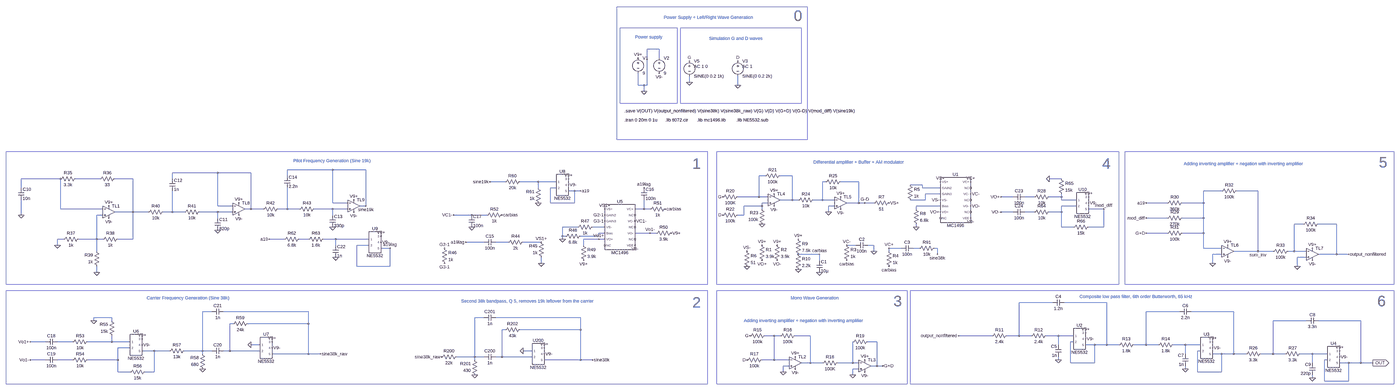
[diagram p0: schematic FM_Encoder.asc, whole sheet]
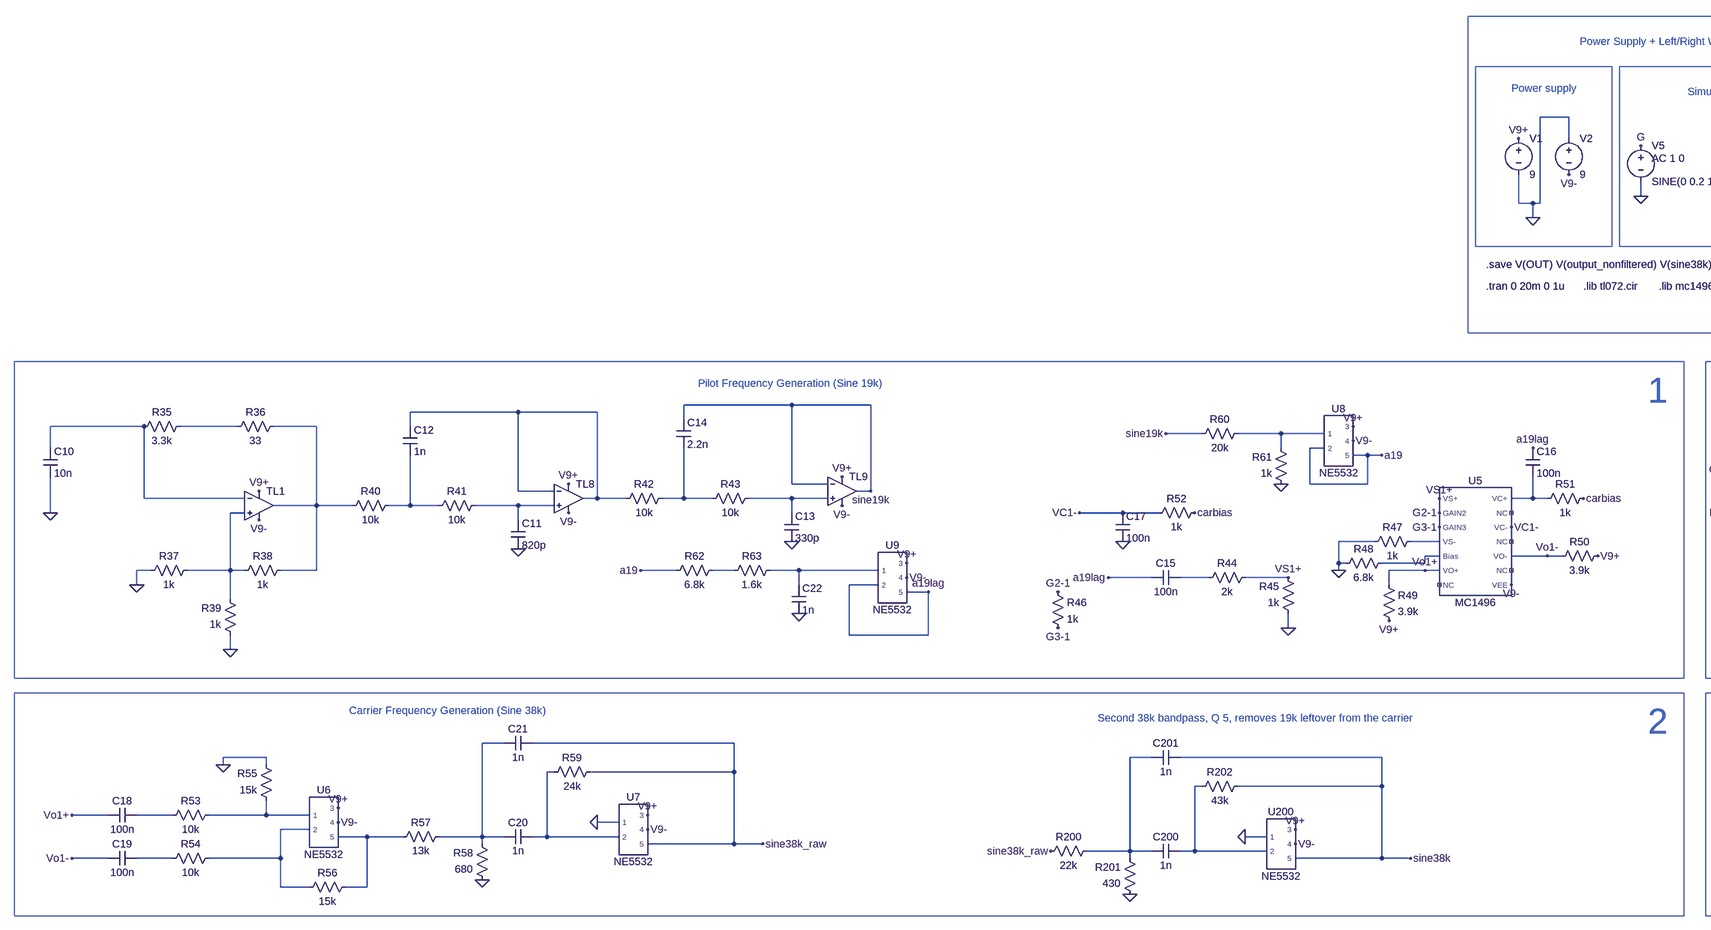
[diagram p1: schematic FM_Encoder.asc, part, row 1 of 1, column 1 of 2]
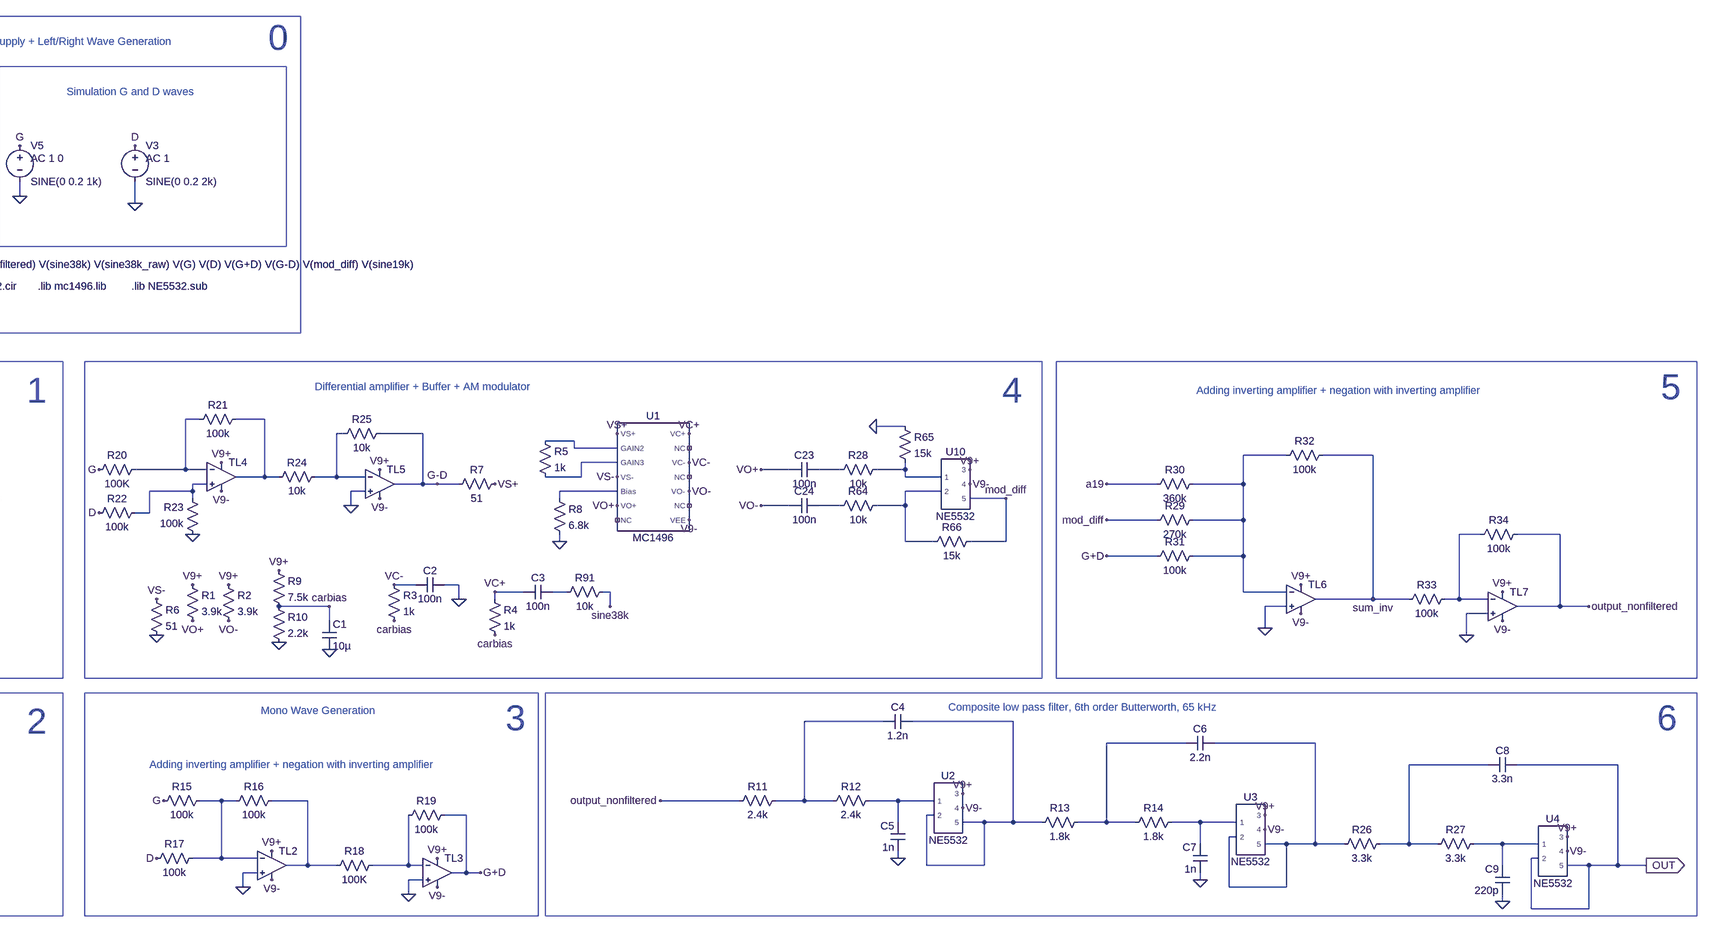
[diagram p2: schematic FM_Encoder.asc, part, row 1 of 1, column 2 of 2]
FM_Encoder.asc, the LTspice schematic file:
Version 4.1
SHEET 1 17428 680
WIRE -4272 -6784 -4336 -6784
WIRE -4272 -6736 -4272 -6784
WIRE -4112 -6608 -4112 -6640
WIRE -4384 -6592 -4384 -6656
WIRE -4352 -6592 -4384 -6592
WIRE -4336 -6592 -4336 -6784
WIRE -4336 -6592 -4352 -6592
WIRE -3856 -6592 -3856 -6640
WIRE -4352 -6560 -4352 -6592
WIRE -6000 -6144 -6240 -6144
WIRE -5824 -6144 -6000 -6144
WIRE -6608 -6128 -6848 -6128
WIRE -6432 -6128 -6608 -6128
WIRE -6240 -6112 -6240 -6144
WIRE -3712 -6112 -3744 -6112
WIRE -3568 -6112 -3632 -6112
WIRE -7440 -6096 -7648 -6096
WIRE -7232 -6096 -7360 -6096
WIRE -7056 -6096 -7152 -6096
WIRE -6848 -6096 -6848 -6128
WIRE -2144 -6096 -2208 -6096
WIRE -5088 -6080 -5168 -6080
WIRE -4912 -6080 -5008 -6080
WIRE -4816 -6080 -4912 -6080
WIRE -3392 -6080 -3408 -6080
WIRE -3216 -6080 -3312 -6080
WIRE -2880 -6064 -2944 -6064
WIRE -7648 -6048 -7648 -6096
WIRE -4912 -6048 -4912 -6080
WIRE -4816 -6048 -4848 -6048
WIRE -2880 -6048 -2880 -6064
WIRE -2784 -6048 -2880 -6048
WIRE -4720 -6032 -4752 -6032
WIRE -4688 -6032 -4720 -6032
WIRE -1296 -6032 -1392 -6032
WIRE -1104 -6032 -1216 -6032
WIRE -2784 -6016 -2864 -6016
WIRE -3744 -6000 -3744 -6112
WIRE -3744 -6000 -3856 -6000
WIRE -3696 -6000 -3744 -6000
WIRE -2400 -6000 -2464 -6000
WIRE -2288 -6000 -2336 -6000
WIRE -2144 -6000 -2144 -6016
WIRE -2144 -6000 -2208 -6000
WIRE -3568 -5984 -3568 -6112
WIRE -3568 -5984 -3632 -5984
WIRE -3536 -5984 -3568 -5984
WIRE -3408 -5984 -3408 -6080
WIRE -3408 -5984 -3456 -5984
WIRE -3344 -5984 -3408 -5984
WIRE -2864 -5984 -2864 -6016
WIRE -2864 -5984 -2944 -5984
WIRE -2144 -5984 -2144 -6000
WIRE -2064 -5984 -2144 -5984
WIRE -6000 -5968 -6000 -6144
WIRE -5920 -5968 -6000 -5968
WIRE -4848 -5968 -4848 -6048
WIRE -4720 -5968 -4720 -6032
WIRE -4720 -5968 -4848 -5968
WIRE -3696 -5968 -3728 -5968
WIRE -3216 -5968 -3216 -6080
WIRE -3216 -5968 -3280 -5968
WIRE -3184 -5968 -3216 -5968
WIRE -3136 -5968 -3184 -5968
WIRE -1584 -5968 -1696 -5968
WIRE -1392 -5968 -1392 -6032
WIRE -1392 -5968 -1504 -5968
WIRE -6608 -5952 -6608 -6128
WIRE -6528 -5952 -6608 -5952
WIRE -5824 -5952 -5824 -6144
WIRE -5824 -5952 -5856 -5952
WIRE -3728 -5952 -3728 -5968
WIRE -3728 -5952 -3824 -5952
WIRE -3344 -5952 -3376 -5952
WIRE -2784 -5952 -2912 -5952
WIRE -2064 -5952 -2144 -5952
WIRE -7440 -5936 -7440 -6096
WIRE -7216 -5936 -7440 -5936
WIRE -6432 -5936 -6432 -6128
WIRE -6432 -5936 -6464 -5936
WIRE -6368 -5936 -6432 -5936
WIRE -6240 -5936 -6240 -6048
WIRE -6240 -5936 -6288 -5936
WIRE -6176 -5936 -6240 -5936
WIRE -6000 -5936 -6096 -5936
WIRE -5920 -5936 -6000 -5936
WIRE -4352 -5936 -4352 -5984
WIRE -4352 -5936 -4400 -5936
WIRE -4320 -5936 -4352 -5936
WIRE -3728 -5936 -3728 -5952
WIRE -2912 -5936 -2912 -5952
WIRE -1920 -5936 -2000 -5936
WIRE -7056 -5920 -7056 -6096
WIRE -7056 -5920 -7152 -5920
WIRE -6976 -5920 -7056 -5920
WIRE -6848 -5920 -6848 -6032
WIRE -6848 -5920 -6896 -5920
WIRE -6784 -5920 -6848 -5920
WIRE -6608 -5920 -6704 -5920
WIRE -6528 -5920 -6608 -5920
WIRE -3376 -5920 -3376 -5952
WIRE -2400 -5920 -2464 -5920
WIRE -2288 -5920 -2336 -5920
WIRE -2144 -5920 -2144 -5952
WIRE -2144 -5920 -2208 -5920
WIRE -7648 -5904 -7648 -5984
WIRE -7216 -5904 -7248 -5904
WIRE -6000 -5904 -6000 -5936
WIRE -5264 -5904 -5360 -5904
WIRE -5184 -5904 -5264 -5904
WIRE -3824 -5904 -3824 -5952
WIRE -3824 -5904 -3856 -5904
WIRE -6608 -5888 -6608 -5920
WIRE -1584 -5888 -1696 -5888
WIRE -1392 -5888 -1392 -5968
WIRE -1392 -5888 -1504 -5888
WIRE -864 -5856 -912 -5856
WIRE -688 -5856 -784 -5856
WIRE -4704 -5840 -4784 -5840
WIRE -4560 -5840 -4624 -5840
WIRE -2912 -5840 -2912 -5856
WIRE -2144 -5840 -2144 -5920
WIRE -2080 -5840 -2144 -5840
WIRE -1920 -5840 -1920 -5936
WIRE -1920 -5840 -2000 -5840
WIRE -4560 -5808 -4592 -5808
WIRE -4320 -5808 -4400 -5808
WIRE -4288 -5808 -4320 -5808
WIRE -1584 -5808 -1696 -5808
WIRE -1392 -5808 -1392 -5888
WIRE -1392 -5808 -1504 -5808
WIRE -4784 -5792 -4784 -5840
WIRE -4768 -5792 -4784 -5792
WIRE -4592 -5792 -4592 -5808
WIRE -4592 -5792 -4688 -5792
WIRE -7424 -5776 -7456 -5776
WIRE -7248 -5776 -7248 -5904
WIRE -7248 -5776 -7344 -5776
WIRE -7216 -5776 -7248 -5776
WIRE -7056 -5776 -7056 -5920
WIRE -7056 -5776 -7136 -5776
WIRE -6256 -5776 -6336 -5776
WIRE -6128 -5776 -6176 -5776
WIRE -5984 -5776 -6048 -5776
WIRE -5808 -5776 -5984 -5776
WIRE -4784 -5776 -4784 -5792
WIRE -4592 -5776 -4672 -5776
WIRE -4560 -5776 -4592 -5776
WIRE -5200 -5760 -5296 -5760
WIRE -5072 -5760 -5136 -5760
WIRE -4896 -5760 -4992 -5760
WIRE -7456 -5744 -7456 -5776
WIRE -5984 -5744 -5984 -5776
WIRE -5808 -5744 -5872 -5744
WIRE -4672 -5744 -4672 -5776
WIRE -3232 -5744 -3280 -5744
WIRE -3136 -5744 -3168 -5744
WIRE -5696 -5728 -5744 -5728
WIRE -2992 -5728 -3056 -5728
WIRE -2896 -5728 -2928 -5728
WIRE -2800 -5728 -2816 -5728
WIRE -1392 -5728 -1392 -5808
WIRE -1296 -5728 -1392 -5728
WIRE -7248 -5712 -7248 -5776
WIRE -3136 -5712 -3136 -5744
WIRE -3056 -5712 -3056 -5728
WIRE -1104 -5712 -1104 -6032
WIRE -1104 -5712 -1232 -5712
WIRE -1024 -5712 -1104 -5712
WIRE -912 -5712 -912 -5856
WIRE -912 -5712 -944 -5712
WIRE -848 -5712 -912 -5712
WIRE -3424 -5696 -3536 -5696
WIRE -2800 -5696 -2800 -5728
WIRE -1296 -5696 -1344 -5696
WIRE -688 -5696 -688 -5856
WIRE -688 -5696 -784 -5696
WIRE -624 -5696 -688 -5696
WIRE -848 -5680 -896 -5680
WIRE -3424 -5664 -3424 -5696
WIRE -4896 -5648 -4896 -5680
WIRE -1344 -5648 -1344 -5696
WIRE -5872 -5632 -5872 -5744
WIRE -5696 -5632 -5696 -5728
WIRE -5696 -5632 -5872 -5632
WIRE -896 -5632 -896 -5680
WIRE -7248 -5600 -7248 -5632
WIRE -2192 -5440 -2368 -5440
WIRE -1904 -5440 -2128 -5440
WIRE -6640 -5392 -6688 -5392
WIRE -6128 -5392 -6576 -5392
WIRE -1520 -5392 -1696 -5392
WIRE -1232 -5392 -1456 -5392
WIRE -7168 -5360 -7264 -5360
WIRE -5200 -5360 -5248 -5360
WIRE -4688 -5360 -5136 -5360
WIRE -7264 -5344 -7264 -5360
WIRE -7168 -5344 -7168 -5360
WIRE -848 -5344 -1024 -5344
WIRE -560 -5344 -784 -5344
WIRE -6528 -5328 -6544 -5328
WIRE -6128 -5328 -6128 -5392
WIRE -6128 -5328 -6448 -5328
WIRE -5088 -5296 -5104 -5296
WIRE -4688 -5296 -4688 -5360
WIRE -4688 -5296 -5008 -5296
WIRE -3664 -5264 -3712 -5264
WIRE -3632 -5264 -3664 -5264
WIRE -3472 -5264 -3552 -5264
WIRE -2512 -5264 -2688 -5264
WIRE -2368 -5264 -2368 -5440
WIRE -2368 -5264 -2432 -5264
WIRE -2304 -5264 -2368 -5264
WIRE -2160 -5264 -2224 -5264
WIRE -2080 -5264 -2160 -5264
WIRE -7520 -5232 -7600 -5232
WIRE -7376 -5232 -7456 -5232
WIRE -7168 -5232 -7168 -5264
WIRE -7168 -5232 -7296 -5232
WIRE -7072 -5232 -7168 -5232
WIRE -3120 -5232 -3168 -5232
WIRE -2080 -5232 -2096 -5232
WIRE -6384 -5216 -6432 -5216
WIRE -2160 -5216 -2160 -5264
WIRE -1968 -5216 -2016 -5216
WIRE -1904 -5216 -1904 -5440
WIRE -1904 -5216 -1968 -5216
WIRE -1840 -5216 -1904 -5216
WIRE -1696 -5216 -1696 -5392
WIRE -1696 -5216 -1760 -5216
WIRE -1632 -5216 -1696 -5216
WIRE -1488 -5216 -1552 -5216
WIRE -1408 -5216 -1488 -5216
WIRE -7072 -5200 -7136 -5200
WIRE -6944 -5184 -7008 -5184
WIRE -6864 -5184 -6944 -5184
WIRE -6688 -5184 -6688 -5392
WIRE -6688 -5184 -6784 -5184
WIRE -6640 -5184 -6688 -5184
WIRE -6544 -5184 -6544 -5328
WIRE -6544 -5184 -6576 -5184
WIRE -6384 -5184 -6544 -5184
WIRE -4944 -5184 -4992 -5184
WIRE -1408 -5184 -1424 -5184
WIRE -6688 -5168 -6688 -5184
WIRE -6128 -5168 -6128 -5328
WIRE -6128 -5168 -6320 -5168
WIRE -6064 -5168 -6128 -5168
WIRE -1488 -5168 -1488 -5216
WIRE -1296 -5168 -1344 -5168
WIRE -1232 -5168 -1232 -5392
WIRE -1232 -5168 -1296 -5168
WIRE -1168 -5168 -1232 -5168
WIRE -1024 -5168 -1024 -5344
WIRE -1024 -5168 -1088 -5168
WIRE -960 -5168 -1024 -5168
WIRE -816 -5168 -880 -5168
WIRE -736 -5168 -816 -5168
WIRE -5248 -5152 -5248 -5360
WIRE -5248 -5152 -5344 -5152
WIRE -5200 -5152 -5248 -5152
WIRE -5104 -5152 -5104 -5296
WIRE -5104 -5152 -5136 -5152
WIRE -4944 -5152 -5104 -5152
WIRE -7520 -5136 -7600 -5136
WIRE -7376 -5136 -7456 -5136
WIRE -7136 -5136 -7136 -5200
WIRE -7136 -5136 -7296 -5136
WIRE -5248 -5136 -5248 -5152
WIRE -4688 -5136 -4688 -5296
WIRE -4688 -5136 -4880 -5136
WIRE -4624 -5136 -4688 -5136
WIRE -3664 -5136 -3664 -5264
WIRE -3664 -5136 -3728 -5136
WIRE -3584 -5136 -3664 -5136
WIRE -2160 -5136 -2160 -5152
WIRE -736 -5136 -752 -5136
WIRE -3472 -5120 -3472 -5264
WIRE -3472 -5120 -3520 -5120
WIRE -3408 -5120 -3472 -5120
WIRE -3248 -5120 -3248 -5232
WIRE -3248 -5120 -3328 -5120
WIRE -3216 -5120 -3248 -5120
WIRE -2096 -5120 -2096 -5232
WIRE -1968 -5120 -1968 -5216
WIRE -1968 -5120 -2096 -5120
WIRE -816 -5120 -816 -5168
WIRE -624 -5120 -672 -5120
WIRE -560 -5120 -560 -5344
WIRE -560 -5120 -624 -5120
WIRE -496 -5120 -560 -5120
WIRE -3584 -5104 -3616 -5104
WIRE -3120 -5104 -3120 -5232
WIRE -3120 -5104 -3152 -5104
WIRE -3088 -5104 -3120 -5104
WIRE -3216 -5088 -3248 -5088
WIRE -1488 -5088 -1488 -5104
WIRE -7136 -5072 -7136 -5136
WIRE -7072 -5072 -7136 -5072
WIRE -6944 -5072 -6944 -5184
WIRE -6944 -5072 -6992 -5072
WIRE -3616 -5072 -3616 -5104
WIRE -1424 -5072 -1424 -5184
WIRE -1296 -5072 -1296 -5168
WIRE -1296 -5072 -1424 -5072
WIRE -3248 -5056 -3248 -5088
WIRE -816 -5040 -816 -5056
WIRE -752 -5024 -752 -5136
WIRE -624 -5024 -624 -5120
WIRE -624 -5024 -752 -5024
FLAG -4384 -6736 V9+
FLAG -4272 -6656 V9-
FLAG -4352 -6560 0
FLAG -3808 -5136 D
FLAG -3792 -5264 G
FLAG -3552 -5152 V9+
FLAG -3552 -5088 V9-
FLAG -3616 -5072 0
FLAG -3184 -5136 V9+
FLAG -3184 -5072 V9-
FLAG -3248 -5056 0
FLAG -3088 -5104 G+D
FLAG -3664 -6016 V9+
FLAG -3664 -5952 V9-
FLAG -3728 -5856 0
FLAG -3936 -5904 D
FLAG -3936 -6000 G
FLAG -3312 -6000 V9+
FLAG -3312 -5936 V9-
FLAG -3376 -5920 0
FLAG -1696 -5968 a19
FLAG -1696 -5888 mod_diff
FLAG -1696 -5808 G+D
FLAG -1264 -5744 V9+
FLAG -1264 -5680 V9-
FLAG -1344 -5648 0
FLAG -816 -5728 V9+
FLAG -816 -5664 V9-
FLAG -896 -5632 0
FLAG -624 -5696 output_nonfiltered
FLAG -4112 -6608 0
FLAG -3856 -6592 0
FLAG -4112 -6720 G
FLAG -3856 -6720 D
FLAG -3184 -5968 G-D
FLAG -2624 -5888 V9-
FLAG -2784 -5920 VO+
FLAG -2624 -5952 VO-
FLAG -3648 -5664 VO-
FLAG -3728 -5664 VO+
FLAG -3728 -5744 V9+
FLAG -3648 -5744 V9+
FLAG -3808 -5632 0
FLAG -3808 -5712 VS-
FLAG -2784 -5984 VS-
FLAG -2624 -6016 VC-
FLAG -3280 -5744 VC-
FLAG -2784 -6080 VS+
FLAG -3056 -5968 VS+
FLAG -2912 -5840 0
FLAG -3280 -5664 carbias
FLAG -3536 -5616 0
FLAG -3424 -5600 0
FLAG -3536 -5776 V9+
FLAG -2624 -6080 VC+
FLAG -3136 -5712 0
FLAG -3056 -5728 VC+
FLAG -3056 -5632 carbias
FLAG -2800 -5696 sine38k
FLAG -3424 -5696 carbias
FLAG -2688 -5264 output_nonfiltered
FLAG -2160 -5136 0
FLAG -2016 -5280 V9+
FLAG -2016 -5248 V9-
FLAG -1488 -5088 0
FLAG -1344 -5232 V9+
FLAG -1344 -5200 V9-
FLAG -816 -5040 0
FLAG -672 -5184 V9+
FLAG -672 -5152 V9-
FLAG -496 -5120 OUT
IOPIN -496 -5120 Out
FLAG -7184 -5952 V9+
FLAG -7184 -5888 V9-
FLAG -7648 -5904 0
FLAG -7456 -5744 0
FLAG -7248 -5600 0
FLAG -6496 -5968 V9+
FLAG -6496 -5904 V9-
FLAG -6608 -5824 0
FLAG -5888 -5984 V9+
FLAG -5888 -5920 V9-
FLAG -6000 -5840 0
FLAG -5824 -5952 sine19k
FLAG -5296 -5760 a19lag
FLAG -4896 -5648 0
FLAG -4896 -5760 VS1+
FLAG -4560 -5936 VS1+
FLAG -4560 -5904 G2-1
FLAG -5408 -5728 G2-1
FLAG -4560 -5872 G3-1
FLAG -5408 -5648 G3-1
FLAG -4784 -5776 0
FLAG -4672 -5664 V9+
FLAG -4592 -5776 Vo1+
FLAG -4400 -5744 V9-
FLAG -4208 -5808 V9+
FLAG -4320 -5808 Vo1-
FLAG -4352 -6048 a19lag
FLAG -4400 -5872 VC1-
FLAG -5360 -5904 VC1-
FLAG -5264 -5840 0
FLAG -5104 -5904 carbias
FLAG -4240 -5936 carbias
FLAG -7600 -5232 Vo1+
FLAG -7600 -5136 Vo1-
FLAG -7264 -5344 0
FLAG -7008 -5248 V9+
FLAG -7008 -5216 V9-
FLAG -6688 -5088 0
FLAG -6432 -5216 0
FLAG -6320 -5232 V9+
FLAG -6320 -5200 V9-
FLAG -5168 -6080 sine19k
FLAG -4912 -5968 0
FLAG -4688 -6032 a19
FLAG -4752 -6096 V9+
FLAG -4752 -6064 V9-
FLAG -6064 -5168 sine38k_raw
FLAG -6336 -5776 a19
FLAG -5984 -5680 0
FLAG -5696 -5728 a19lag
FLAG -5744 -5792 V9+
FLAG -5744 -5760 V9-
FLAG -1104 -5712 sum_inv
FLAG -2464 -5920 VO-
FLAG -2464 -6000 VO+
FLAG -2000 -6000 V9+
FLAG -2000 -5968 V9-
FLAG -1920 -5936 mod_diff
FLAG -2208 -6096 0
FLAG -5248 -5056 0
FLAG -4992 -5184 0
FLAG -4880 -5200 V9+
FLAG -4880 -5168 V9-
FLAG -4624 -5136 sine38k
FLAG -5424 -5152 sine38k_raw
SYMBOL voltage -4384 -6752 R0
WINDOW 123 0 0 Left 0
WINDOW 39 0 0 Left 0
SYMATTR InstName V1
SYMATTR Value 9
SYMBOL voltage -4272 -6752 R0
WINDOW 123 0 0 Left 0
WINDOW 39 0 0 Left 0
SYMATTR InstName V2
SYMATTR Value 9
SYMBOL res -3696 -5280 R90
WINDOW 0 0 56 VBottom 2
WINDOW 3 32 56 VTop 2
SYMATTR InstName R15
SYMATTR Value 100k
SYMBOL res -3536 -5280 R90
WINDOW 0 0 56 VBottom 2
WINDOW 3 32 56 VTop 2
SYMATTR InstName R16
SYMATTR Value 100k
SYMBOL res -3712 -5152 R90
WINDOW 0 0 56 VBottom 2
WINDOW 3 32 56 VTop 2
SYMATTR InstName R17
SYMATTR Value 100k
SYMBOL OpAmps\\opamp2 -3552 -5184 R0
SYMATTR InstName TL2
SYMATTR Value ""
SYMATTR SpiceModel TL072
SYMBOL res -3312 -5136 R90
WINDOW 0 0 56 VBottom 2
WINDOW 3 32 56 VTop 2
SYMATTR InstName R18
SYMATTR Value 100K
SYMBOL res -3152 -5248 R90
WINDOW 0 0 56 VBottom 2
WINDOW 3 32 56 VTop 2
SYMATTR InstName R19
SYMATTR Value 100k
SYMBOL OpAmps\\opamp2 -3184 -5168 R0
SYMATTR InstName TL3
SYMATTR Value ""
SYMATTR SpiceModel TL072
SYMBOL res -3840 -6016 R90
WINDOW 0 0 56 VBottom 2
WINDOW 3 32 56 VTop 2
SYMATTR InstName R20
SYMATTR Value 100K
SYMBOL res -3616 -6128 R90
WINDOW 0 0 56 VBottom 2
WINDOW 3 32 56 VTop 2
SYMATTR InstName R21
SYMATTR Value 100k
SYMBOL res -3840 -5920 R90
WINDOW 0 0 56 VBottom 2
WINDOW 3 32 56 VTop 2
SYMATTR InstName R22
SYMATTR Value 100k
SYMBOL res -3712 -5840 R180
WINDOW 0 36 76 Left 2
WINDOW 3 36 40 Left 2
SYMATTR InstName R23
SYMATTR Value 100k
SYMBOL OpAmps\\opamp2 -3664 -6048 R0
SYMATTR InstName TL4
SYMATTR Value ""
SYMATTR SpiceModel TL072
SYMBOL res -3440 -6000 R90
WINDOW 0 0 56 VBottom 2
WINDOW 3 32 56 VTop 2
SYMATTR InstName R24
SYMATTR Value 10k
SYMBOL res -3296 -6096 R90
WINDOW 0 0 56 VBottom 2
WINDOW 3 32 56 VTop 2
SYMATTR InstName R25
SYMATTR Value 10k
SYMBOL OpAmps\\opamp2 -3312 -6032 R0
SYMATTR InstName TL5
SYMATTR Value ""
SYMATTR SpiceModel TL072
SYMBOL res -1488 -5904 R90
WINDOW 0 0 56 VBottom 2
WINDOW 3 32 56 VTop 2
SYMATTR InstName R29
SYMATTR Value 270k
SYMBOL res -1488 -5984 R90
WINDOW 0 0 56 VBottom 2
WINDOW 3 32 56 VTop 2
SYMATTR InstName R30
SYMATTR Value 360k
SYMBOL res -1488 -5824 R90
WINDOW 0 0 56 VBottom 2
WINDOW 3 32 56 VTop 2
SYMATTR InstName R31
SYMATTR Value 100k
SYMBOL res -1200 -6048 R90
WINDOW 0 0 56 VBottom 2
WINDOW 3 32 56 VTop 2
SYMATTR InstName R32
SYMATTR Value 100k
SYMBOL OpAmps\\opamp2 -1264 -5776 R0
SYMATTR InstName TL6
SYMATTR Value ""
SYMATTR SpiceModel TL072
SYMBOL res -928 -5728 R90
WINDOW 0 0 56 VBottom 2
WINDOW 3 32 56 VTop 2
SYMATTR InstName R33
SYMATTR Value 100k
SYMBOL OpAmps\\opamp2 -816 -5760 R0
SYMATTR InstName TL7
SYMATTR Value ""
SYMATTR SpiceModel TL072
SYMBOL res -768 -5872 R90
WINDOW 0 0 56 VBottom 2
WINDOW 3 32 56 VTop 2
SYMATTR InstName R34
SYMATTR Value 100k
SYMBOL voltage -4112 -6736 R0
WINDOW 123 24 44 Left 2
WINDOW 39 0 0 Left 0
SYMATTR Value2 AC 1 0
SYMATTR InstName V5
SYMATTR Value SINE(0 0.2 1k)
SYMBOL MC1496 -2704 -5984 R0
SYMATTR InstName U1
SYMBOL res -3744 -5760 R0
SYMATTR InstName R1
SYMATTR Value 3.9k
SYMBOL res -3664 -5760 R0
SYMATTR InstName R2
SYMATTR Value 3.9k
SYMBOL res -2960 -6080 R0
SYMATTR InstName R5
SYMATTR Value 1k
SYMBOL res -3824 -5728 R0
SYMATTR InstName R6
SYMATTR Value 51
SYMBOL res -3296 -5760 R0
SYMATTR InstName R3
SYMATTR Value 1k
SYMBOL res -3040 -5984 R90
WINDOW 0 0 56 VBottom 2
WINDOW 3 32 56 VTop 2
SYMATTR InstName R7
SYMATTR Value 51
SYMBOL res -2928 -5952 R0
SYMATTR InstName R8
SYMATTR Value 6.8k
SYMBOL res -3552 -5792 R0
SYMATTR InstName R9
SYMATTR Value 7.5k
SYMBOL res -3552 -5712 R0
SYMATTR InstName R10
SYMATTR Value 2.2k
SYMBOL cap -3440 -5664 R0
SYMATTR InstName C1
SYMATTR Value 10µ
SYMBOL cap -3168 -5760 R90
WINDOW 0 0 32 VBottom 2
WINDOW 3 32 32 VTop 2
SYMATTR InstName C2
SYMATTR Value 100n
SYMBOL res -3072 -5728 R0
SYMATTR InstName R4
SYMATTR Value 1k
SYMBOL cap -2928 -5744 R90
WINDOW 0 0 32 VBottom 2
WINDOW 3 32 32 VTop 2
SYMATTR InstName C3
SYMATTR Value 100n
SYMBOL res -2416 -5280 R90
WINDOW 0 0 56 VBottom 2
WINDOW 3 32 56 VTop 2
SYMATTR InstName R11
SYMATTR Value 2.4k
SYMBOL res -2208 -5280 R90
WINDOW 0 0 56 VBottom 2
WINDOW 3 32 56 VTop 2
SYMATTR InstName R12
SYMATTR Value 2.4k
SYMBOL cap -2128 -5456 R90
WINDOW 0 0 32 VBottom 2
WINDOW 3 32 32 VTop 2
SYMATTR InstName C4
SYMATTR Value 1.2n
SYMBOL cap -2144 -5152 R180
WINDOW 0 24 56 Left 2
WINDOW 3 24 8 Left 2
SYMATTR InstName C5
SYMATTR Value 1n
SYMBOL NE5532 -2048 -5248 R0
SYMATTR InstName U2
SYMBOL res -1744 -5232 R90
WINDOW 0 0 56 VBottom 2
WINDOW 3 32 56 VTop 2
SYMATTR InstName R13
SYMATTR Value 1.8k
SYMBOL res -1536 -5232 R90
WINDOW 0 0 56 VBottom 2
WINDOW 3 32 56 VTop 2
SYMATTR InstName R14
SYMATTR Value 1.8k
SYMBOL cap -1456 -5408 R90
WINDOW 0 0 32 VBottom 2
WINDOW 3 32 32 VTop 2
SYMATTR InstName C6
SYMATTR Value 2.2n
SYMBOL cap -1472 -5104 R180
WINDOW 0 24 56 Left 2
WINDOW 3 24 8 Left 2
SYMATTR InstName C7
SYMATTR Value 1n
SYMBOL NE5532 -1376 -5200 R0
SYMATTR InstName U3
SYMBOL res -1072 -5184 R90
WINDOW 0 0 56 VBottom 2
WINDOW 3 32 56 VTop 2
SYMATTR InstName R26
SYMATTR Value 3.3k
SYMBOL res -864 -5184 R90
WINDOW 0 0 56 VBottom 2
WINDOW 3 32 56 VTop 2
SYMATTR InstName R27
SYMATTR Value 3.3k
SYMBOL cap -784 -5360 R90
WINDOW 0 0 32 VBottom 2
WINDOW 3 32 32 VTop 2
SYMATTR InstName C8
SYMATTR Value 3.3n
SYMBOL cap -800 -5056 R180
WINDOW 0 24 56 Left 2
WINDOW 3 24 8 Left 2
SYMATTR InstName C9
SYMATTR Value 220p
SYMBOL NE5532 -704 -5152 R0
SYMATTR InstName U4
SYMBOL OpAmps\\opamp2 -7184 -5984 R0
SYMATTR InstName TL1
SYMATTR Value ""
SYMATTR SpiceModel TL072
SYMBOL cap -7664 -6048 R0
SYMATTR InstName C10
SYMATTR Value 10n
SYMBOL res -7344 -6112 R90
WINDOW 0 0 56 VBottom 2
WINDOW 3 32 56 VTop 2
SYMATTR InstName R35
SYMATTR Value 3.3k
SYMBOL res -7136 -6112 R90
WINDOW 0 0 56 VBottom 2
WINDOW 3 32 56 VTop 2
SYMATTR InstName R36
SYMATTR Value 33
SYMBOL res -7328 -5792 R90
WINDOW 0 0 56 VBottom 2
WINDOW 3 32 56 VTop 2
SYMATTR InstName R37
SYMATTR Value 1k
SYMBOL res -7120 -5792 R90
WINDOW 0 0 56 VBottom 2
WINDOW 3 32 56 VTop 2
SYMATTR InstName R38
SYMATTR Value 1k
SYMBOL res -7232 -5616 R180
WINDOW 0 36 76 Left 2
WINDOW 3 36 40 Left 2
SYMATTR InstName R39
SYMATTR Value 1k
SYMBOL res -6880 -5936 R90
WINDOW 0 0 56 VBottom 2
WINDOW 3 32 56 VTop 2
SYMATTR InstName R40
SYMATTR Value 10k
SYMBOL res -6688 -5936 R90
WINDOW 0 0 56 VBottom 2
WINDOW 3 32 56 VTop 2
SYMATTR InstName R41
SYMATTR Value 10k
SYMBOL cap -6624 -5888 R0
SYMATTR InstName C11
SYMATTR Value 820p
SYMBOL cap -6864 -6096 R0
SYMATTR InstName C12
SYMATTR Value 1n
SYMBOL OpAmps\\opamp2 -6496 -6000 R0
SYMATTR InstName TL8
SYMATTR Value ""
SYMATTR SpiceModel TL072
SYMBOL res -6272 -5952 R90
WINDOW 0 0 56 VBottom 2
WINDOW 3 32 56 VTop 2
SYMATTR InstName R42
SYMATTR Value 10k
SYMBOL res -6080 -5952 R90
WINDOW 0 0 56 VBottom 2
WINDOW 3 32 56 VTop 2
SYMATTR InstName R43
SYMATTR Value 10k
SYMBOL cap -6016 -5904 R0
SYMATTR InstName C13
SYMATTR Value 330p
SYMBOL cap -6256 -6112 R0
SYMATTR InstName C14
SYMATTR Value 2.2n
SYMBOL OpAmps\\opamp2 -5888 -6016 R0
SYMATTR InstName TL9
SYMATTR Value ""
SYMATTR SpiceModel TL072
SYMBOL cap -5136 -5776 R90
WINDOW 0 0 32 VBottom 2
WINDOW 3 32 32 VTop 2
SYMATTR InstName C15
SYMATTR Value 100n
SYMBOL res -4976 -5776 R90
WINDOW 0 0 56 VBottom 2
WINDOW 3 32 56 VTop 2
SYMATTR InstName R44
SYMATTR Value 2k
SYMBOL res -4880 -5664 R180
WINDOW 0 36 76 Left 2
WINDOW 3 36 40 Left 2
SYMATTR InstName R45
SYMATTR Value 1k
SYMBOL MC1496 -4480 -5840 R0
SYMATTR InstName U5
SYMBOL res -5424 -5744 R0
SYMATTR InstName R46
SYMATTR Value 1k
SYMBOL res -4608 -5856 R90
WINDOW 0 0 56 VBottom 2
WINDOW 3 32 56 VTop 2
SYMATTR InstName R47
SYMATTR Value 1k
SYMBOL res -4672 -5808 R90
WINDOW 0 0 56 VBottom 2
WINDOW 3 32 56 VTop 2
SYMATTR InstName R48
SYMATTR Value 6.8k
SYMBOL res -4688 -5760 R0
SYMATTR InstName R49
SYMATTR Value 3.9k
SYMBOL res -4192 -5824 R90
WINDOW 0 0 56 VBottom 2
WINDOW 3 32 56 VTop 2
SYMATTR InstName R50
SYMATTR Value 3.9k
SYMBOL res -4224 -5952 R90
WINDOW 0 0 56 VBottom 2
WINDOW 3 32 56 VTop 2
SYMATTR InstName R51
SYMATTR Value 1k
SYMBOL cap -4368 -6048 R0
SYMATTR InstName C16
SYMATTR Value 100n
SYMBOL cap -5280 -5904 R0
SYMATTR InstName C17
SYMATTR Value 100n
SYMBOL res -5088 -5920 R90
WINDOW 0 0 56 VBottom 2
WINDOW 3 32 56 VTop 2
SYMATTR InstName R52
SYMATTR Value 1k
SYMBOL cap -7456 -5248 R90
WINDOW 0 0 32 VBottom 2
WINDOW 3 32 32 VTop 2
SYMATTR InstName C18
SYMATTR Value 100n
SYMBOL cap -7456 -5152 R90
WINDOW 0 0 32 VBottom 2
WINDOW 3 32 32 VTop 2
SYMATTR InstName C19
SYMATTR Value 100n
SYMBOL res -7280 -5248 R90
WINDOW 0 0 56 VBottom 2
WINDOW 3 32 56 VTop 2
SYMATTR InstName R53
SYMATTR Value 10k
SYMBOL res -7280 -5152 R90
WINDOW 0 0 56 VBottom 2
WINDOW 3 32 56 VTop 2
SYMATTR InstName R54
SYMATTR Value 10k
SYMBOL res -7152 -5248 R180
WINDOW 0 36 76 Left 2
WINDOW 3 36 40 Left 2
SYMATTR InstName R55
SYMATTR Value 15k
SYMBOL NE5532 -7040 -5216 R0
SYMATTR InstName U6
SYMBOL res -6976 -5088 R90
WINDOW 0 0 56 VBottom 2
WINDOW 3 32 56 VTop 2
SYMATTR InstName R56
SYMATTR Value 15k
SYMBOL res -6768 -5200 R90
WINDOW 0 0 56 VBottom 2
WINDOW 3 32 56 VTop 2
SYMATTR InstName R57
SYMATTR Value 13k
SYMBOL res -6672 -5072 R180
WINDOW 0 36 76 Left 2
WINDOW 3 36 40 Left 2
SYMATTR InstName R58
SYMATTR Value 680
SYMBOL cap -6576 -5200 R90
WINDOW 0 0 32 VBottom 2
WINDOW 3 32 32 VTop 2
SYMATTR InstName C20
SYMATTR Value 1n
SYMBOL cap -6576 -5408 R90
WINDOW 0 0 32 VBottom 2
WINDOW 3 32 32 VTop 2
SYMATTR InstName C21
SYMATTR Value 1n
SYMBOL res -6432 -5344 R90
WINDOW 0 0 56 VBottom 2
WINDOW 3 32 56 VTop 2
SYMATTR InstName R59
SYMATTR Value 24k
SYMBOL NE5532 -6352 -5200 R0
SYMATTR InstName U7
SYMBOL res -4992 -6096 R90
WINDOW 0 0 56 VBottom 2
WINDOW 3 32 56 VTop 2
SYMATTR InstName R60
SYMATTR Value 20k
SYMBOL res -4896 -5952 R180
WINDOW 0 36 76 Left 2
WINDOW 3 36 40 Left 2
SYMATTR InstName R61
SYMATTR Value 1k
SYMBOL NE5532 -4784 -6064 R0
SYMATTR InstName U8
SYMBOL res -6160 -5792 R90
WINDOW 0 0 56 VBottom 2
WINDOW 3 32 56 VTop 2
SYMATTR InstName R62
SYMATTR Value 6.8k
SYMBOL res -6032 -5792 R90
WINDOW 0 0 56 VBottom 2
WINDOW 3 32 56 VTop 2
SYMATTR InstName R63
SYMATTR Value 1.6k
SYMBOL cap -6000 -5744 R0
SYMATTR InstName C22
SYMATTR Value 1n
SYMBOL NE5532 -5776 -5760 R0
SYMATTR InstName U9
SYMBOL cap -2336 -6016 R90
WINDOW 0 0 32 VBottom 2
WINDOW 3 32 32 VTop 2
SYMATTR InstName C23
SYMATTR Value 100n
SYMBOL cap -2336 -5936 R90
WINDOW 0 0 32 VBottom 2
WINDOW 3 32 32 VTop 2
SYMATTR InstName C24
SYMATTR Value 100n
SYMBOL res -2192 -6016 R90
WINDOW 0 0 56 VBottom 2
WINDOW 3 32 56 VTop 2
SYMATTR InstName R28
SYMATTR Value 10k
SYMBOL res -2192 -5936 R90
WINDOW 0 0 56 VBottom 2
WINDOW 3 32 56 VTop 2
SYMATTR InstName R64
SYMATTR Value 10k
SYMBOL res -2160 -6112 R0
SYMATTR InstName R65
SYMATTR Value 15k
SYMBOL res -1984 -5856 R90
WINDOW 0 0 56 VBottom 2
WINDOW 3 32 56 VTop 2
SYMATTR InstName R66
SYMATTR Value 15k
SYMBOL NE5532 -2032 -5968 R0
SYMATTR InstName U10
SYMBOL res -2800 -5744 R90
WINDOW 0 0 56 VBottom 2
WINDOW 3 32 56 VTop 2
SYMATTR InstName R91
SYMATTR Value 10k
SYMBOL voltage -3856 -6736 R0
WINDOW 123 24 44 Left 2
WINDOW 39 0 0 Left 0
SYMATTR Value2 AC 1
SYMATTR InstName V3
SYMATTR Value SINE(0 0.2 2k)
SYMBOL res -5328 -5168 R90
WINDOW 0 0 56 VBottom 2
WINDOW 3 32 56 VTop 2
SYMATTR InstName R200
SYMATTR Value 22k
SYMBOL res -5232 -5040 R180
WINDOW 0 36 76 Left 2
WINDOW 3 36 40 Left 2
SYMATTR InstName R201
SYMATTR Value 430
SYMBOL cap -5136 -5168 R90
WINDOW 0 0 32 VBottom 2
WINDOW 3 32 32 VTop 2
SYMATTR InstName C200
SYMATTR Value 1n
SYMBOL cap -5136 -5376 R90
WINDOW 0 0 32 VBottom 2
WINDOW 3 32 32 VTop 2
SYMATTR InstName C201
SYMATTR Value 1n
SYMBOL res -4992 -5312 R90
WINDOW 0 0 56 VBottom 2
WINDOW 3 32 56 VTop 2
SYMATTR InstName R202
SYMATTR Value 43k
SYMBOL NE5532 -4912 -5168 R0
SYMATTR InstName U200
TEXT -5320 -5448 Left 2 ;Second 38k bandpass, Q 5, removes 19k leftover from the carrier
TEXT -4400 -6848 Left 2 ;Power supply
TEXT -3824 -5344 Left 2 ;Adding inverting amplifier + negation with inverting amplifier
TEXT -3456 -6184 Left 2 ;Differential amplifier + Buffer + AM modulator
TEXT -1496 -6176 Left 2 ;Adding inverting amplifier + negation with inverting amplifier
TEXT -4008 -6840 Left 2 ;Simulation G and D waves
TEXT -4456 -6408 Left 2 !.tran 0 20m 0 1u
TEXT -4240 -6408 Left 2 !.lib tl072.cir
TEXT -4072 -6408 Left 2 !.lib mc1496.lib
TEXT -3864 -6408 Left 2 !.lib NE5532.sub
TEXT -2048 -5472 Left 2 ;Composite low pass filter, 6th order Butterworth, 65 kHz
TEXT -4456 -6456 Left 2 !.save V(OUT) V(output_nonfiltered) V(sine38k) V(sine38k_raw) V(G) V(D) V(G+D) V(G-D) V(mod_diff) V(sine19k)
TEXT -6208 -6192 Left 2 ;Pilot Frequency Generation (Sine 19k)
TEXT -6984 -5464 Left 2 ;Carrier Frequency Generation (Sine 38k)
TEXT -4096 -6176 Left 6 ;1
TEXT -4096 -5440 Left 6 ;2
TEXT -4248 -6952 Left 2 ;Power Supply + Left/Right Wave Generation
TEXT -3560 -6960 Left 6 ;0
TEXT -3576 -5464 Left 2 ;Mono Wave Generation
TEXT -3032 -5448 Left 6 ;3
TEXT -1928 -6176 Left 6 ;4
TEXT -472 -5448 Left 6 ;6
TEXT -464 -6184 Left 6 ;5
RECTANGLE Normal -3520 -6496 -4160 -6896
RECTANGLE Normal -4480 -6496 -4176 -6896
RECTANGLE Normal -7728 -5536 -4016 -6240
RECTANGLE Normal -7728 -5008 -4016 -5504
RECTANGLE Normal -3488 -6304 -4496 -7008
RECTANGLE Normal -2960 -5008 -3968 -5504
RECTANGLE Normal -1840 -5536 -3968 -6240
RECTANGLE Normal -384 -5504 -2944 -5008
RECTANGLE Normal -384 -5536 -1808 -6240

The netlist it stands for:
* FM_Encoder.asc
V1 V9+ 0 9
V2 0 V9- 9
R15 N040 G 100k
R16 N041 N040 100k
R17 N040 D 100k
X§TL2 0 N040 V9+ V9- N041 TL072  ; pins In+ In- V+ V- OUT
R18 N050 N041 100K
R19 G+D N050 100k
X§TL3 0 N050 V9+ V9- G+D TL072  ; pins In+ In- V+ V- OUT
R20 N002 G 100K
R21 N003 N002 100k
R22 N014 D 100k
R23 0 N014 100k
X§TL4 N014 N002 V9+ V9- N003 TL072  ; pins In+ In- V+ V- OUT
R24 N008 N003 10k
R25 G-D N008 10k
X§TL5 0 N008 V9+ V9- G-D TL072  ; pins In+ In- V+ V- OUT
R29 N010 mod_diff 270k
R30 N010 a19 360k
R31 N010 G+D 100k
R32 sum_inv N010 100k
X§TL6 0 N010 V9+ V9- sum_inv TL072  ; pins In+ In- V+ V- OUT
R33 N024 sum_inv 100k
X§TL7 0 N024 V9+ V9- output_nonfiltered TL072  ; pins In+ In- V+ V- OUT
R34 output_nonfiltered N024 100k
V5 G 0 SINE(0 0.2 1k) AC 1 0
X§U1 VS+ N009 N011 VS- N015 VO+ NC_01 VC+ NC_02 VC- NC_03 VO- NC_04 V9- MC1496  ; pins VS+ GAIN2 GAIN3 VS- Bias VO+ NC VC+ NC VC- NC VO- NC VEE
R1 V9+ VO+ 3.9k
R2 V9+ VO- 3.9k
R5 N009 N011 1k
R6 VS- 0 51
R3 VC- carbias 1k
R7 VS+ G-D 51
R8 N015 0 6.8k
R9 V9+ carbias 7.5k
R10 carbias 0 2.2k
C1 carbias 0 10µ
C2 0 VC- 100n
R4 VC+ carbias 1k
C3 N030 VC+ 100n
R11 N031 output_nonfiltered 2.4k
R12 N042 N031 2.4k
C4 N032 N031 1.2n
C5 0 N042 1n
X§U2 N042 N032 V9+ V9- N032 NE5532  ; pins 1 2 3 4 5
R13 N034 N032 1.8k
R14 N045 N034 1.8k
C6 N035 N034 2.2n
C7 0 N045 1n
X§U3 N045 N035 V9+ V9- N035 NE5532  ; pins 1 2 3 4 5
R26 N037 N035 3.3k
R27 N048 N037 3.3k
C8 OUT N037 3.3n
C9 0 N048 220p
X§U4 N048 OUT V9+ V9- OUT NE5532  ; pins 1 2 3 4 5
X§TL1 N023 N004 V9+ V9- N006 TL072  ; pins In+ In- V+ V- OUT
C10 N004 0 10n
R35 N005 N004 3.3k
R36 N006 N005 33
R37 N023 0 1k
R38 N006 N023 1k
R39 0 N023 1k
R40 N020 N006 10k
R41 N021 N020 10k
C11 N021 0 820p
C12 N001 N020 1n
X§TL8 N021 N001 V9+ V9- N001 TL072  ; pins In+ In- V+ V- OUT
R42 N017 N001 10k
R43 N018 N017 10k
C13 N018 0 330p
C14 sine19k N017 2.2n
X§TL9 N018 sine19k V9+ V9- sine19k TL072  ; pins In+ In- V+ V- OUT
C15 N029 a19lag 100n
R44 VS1+ N029 2k
R45 0 VS1+ 1k
X§U5 VS1+ G2-1 G3-1 N025 N026 Vo1+ NC_05 N019 NC_06 VC1- NC_07 Vo1- NC_08 V9- MC1496  ; pins VS+ GAIN2 GAIN3 VS- Bias VO+ NC VC+ NC VC- NC VO- NC VEE
R46 G2-1 G3-1 1k
R47 N025 0 1k
R48 N026 0 6.8k
R49 Vo1+ V9+ 3.9k
R50 V9+ Vo1- 3.9k
R51 carbias N019 1k
C16 a19lag N019 100n
C17 VC1- 0 100n
R52 carbias VC1- 1k
C18 N043 Vo1+ 100n
C19 N049 Vo1- 100n
R53 N044 N043 10k
R54 N046 N049 10k
R55 N044 0 15k
X§U6 N044 N046 V9+ V9- N047 NE5532  ; pins 1 2 3 4 5
R56 N047 N046 15k
R57 N033 N047 13k
R58 0 N033 680
C20 N038 N033 1n
C21 sine38k_raw N033 1n
R59 sine38k_raw N038 24k
X§U7 0 N038 V9+ V9- sine38k_raw NE5532  ; pins 1 2 3 4 5
R60 N007 sine19k 20k
R61 0 N007 1k
X§U8 N007 a19 V9+ V9- a19 NE5532  ; pins 1 2 3 4 5
R62 N027 a19 6.8k
R63 N028 N027 1.6k
C22 N028 0 1n
X§U9 N028 a19lag V9+ V9- a19lag NE5532  ; pins 1 2 3 4 5
C23 N012 VO+ 100n
C24 N022 VO- 100n
R28 N013 N012 10k
R64 N016 N022 10k
R65 0 N013 15k
R66 mod_diff N016 15k
X§U10 N013 N016 V9+ V9- mod_diff NE5532  ; pins 1 2 3 4 5
R91 sine38k N030 10k
V3 D 0 SINE(0 0.2 2k) AC 1
R200 N036 sine38k_raw 22k
R201 0 N036 430
C200 N039 N036 1n
C201 sine38k N036 1n
R202 sine38k N039 43k
X§U200 0 N039 V9+ V9- sine38k NE5532  ; pins 1 2 3 4 5
* Second 38k bandpass, Q 5, removes 19k leftover from the carrier
* Power supply
* Adding inverting amplifier + negation with inverting amplifier
* Differential amplifier + Buffer + AM modulator
* Adding inverting amplifier + negation with inverting amplifier
* Simulation G and D waves
.tran 0 20m 0 1u
.lib tl072.cir
.lib mc1496.lib
.lib NE5532.sub
* Composite low pass filter, 6th order Butterworth, 65 kHz
.save V(OUT) V(output_nonfiltered) V(sine38k) V(sine38k_raw) V(G) V(D) V(G+D) V(G-D) V(mod_diff) V(sine19k)
* Pilot Frequency Generation (Sine 19k)
* Carrier Frequency Generation (Sine 38k)
* 1
* 2
* Power Supply + Left/Right Wave Generation
* 0
* Mono Wave Generation
* 3
* 4
* 6
* 5
.lib mc1496.lib
.lib NE5532.sub
.backanno
.end